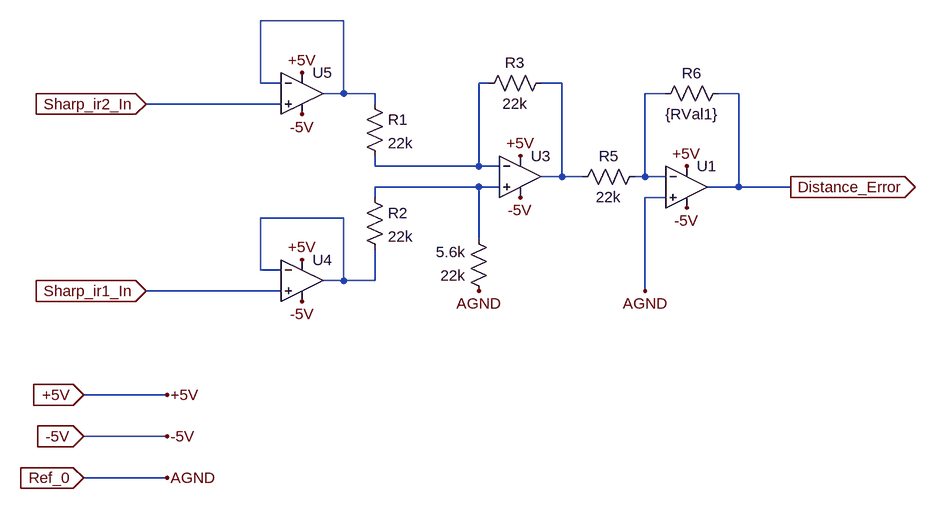
[diagram p0: schematic Sensor_Interface_SharpIR.asc]
Sensor_Interface_SharpIR.asc, the LTspice schematic file:
Version 4.1
SHEET 1 880 680
WIRE -80 -240 -208 -240
WIRE -208 -144 -208 -240
WIRE -176 -144 -208 -144
WIRE 144 -144 128 -144
WIRE 256 -144 224 -144
WIRE -80 -128 -80 -240
WIRE -80 -128 -112 -128
WIRE -32 -128 -80 -128
WIRE 416 -128 384 -128
WIRE 528 -128 496 -128
WIRE -176 -112 -384 -112
WIRE -32 -112 -32 -128
WIRE -32 -16 -32 -32
WIRE 128 -16 128 -144
WIRE 128 -16 -32 -16
WIRE 160 -16 128 -16
WIRE 256 0 256 -144
WIRE 256 0 224 0
WIRE 288 0 256 0
WIRE 384 0 384 -128
WIRE 384 0 368 0
WIRE 416 0 384 0
WIRE 128 16 -32 16
WIRE 160 16 128 16
WIRE 528 16 528 -128
WIRE 528 16 480 16
WIRE 608 16 528 16
WIRE -32 32 -32 16
WIRE 416 32 384 32
WIRE -80 64 -208 64
WIRE 128 96 128 16
WIRE -208 144 -208 64
WIRE -176 144 -208 144
WIRE -80 160 -80 64
WIRE -80 160 -112 160
WIRE -32 160 -32 112
WIRE -32 160 -80 160
WIRE -176 176 -384 176
WIRE 384 176 384 32
WIRE -352 336 -480 336
WIRE -352 400 -480 400
WIRE -352 464 -480 464
FLAG -384 176 Sharp_ir1_In
IOPIN -384 176 In
FLAG -384 -112 Sharp_ir2_In
IOPIN -384 -112 In
FLAG 608 16 Distance_Error
IOPIN 608 16 Out
FLAG 192 -32 +5V
FLAG 448 -16 +5V
FLAG 192 32 -5V
FLAG 448 48 -5V
FLAG -144 128 +5V
FLAG -144 192 -5V
FLAG -144 -160 +5V
FLAG -144 -96 -5V
FLAG 128 176 AGND
FLAG 384 176 AGND
FLAG -480 336 +5V
IOPIN -480 336 In
FLAG -480 400 -5V
IOPIN -480 400 In
FLAG -480 464 Ref_0
IOPIN -480 464 In
FLAG -352 336 +5V
FLAG -352 400 -5V
FLAG -352 464 AGND
SYMBOL OpAmps\\UniversalOpAmp2 192 0 R0
SYMATTR InstName U3
SYMATTR Value2 Avol=200k GBW=3Meg Slew=13Meg
SYMATTR SpiceLine Ilimit=25m Rail=1.5 Vos=3m
SYMATTR SpiceLine2 En=18n Enk=100 In=0.01p Ink=10 Rin=1T
SYMBOL OpAmps\\UniversalOpAmp2 -144 160 R0
SYMATTR InstName U4
SYMATTR Value2 Avol=200k GBW=3Meg Slew=13Meg
SYMATTR SpiceLine Ilimit=25m Rail=1.5 Vos=3m
SYMATTR SpiceLine2 En=18n Enk=100 In=0.01p Ink=10 Rin=1T
SYMBOL OpAmps\\UniversalOpAmp2 -144 -128 R0
SYMATTR InstName U5
SYMATTR Value2 Avol=200k GBW=3Meg Slew=13Meg
SYMATTR SpiceLine Ilimit=25m Rail=1.5 Vos=3m
SYMATTR SpiceLine2 En=18n Enk=100 In=0.01p Ink=10 Rin=1T
SYMBOL res -48 -128 R0
SYMATTR InstName R1
SYMATTR Value 22k
SYMBOL res -48 16 R0
SYMATTR InstName R2
SYMATTR Value 22k
SYMBOL res 240 -160 R90
WINDOW 0 0 56 VBottom 2
WINDOW 3 32 56 VTop 2
SYMATTR InstName R3
SYMATTR Value 22k
SYMBOL res 144 192 R180
WINDOW 0 36 76 Left 2
WINDOW 3 36 40 Left 2
SYMATTR InstName 5.6k
SYMATTR Value 22k
SYMBOL OpAmps\\UniversalOpAmp2 448 16 R0
SYMATTR InstName U1
SYMATTR Value2 Avol=200k GBW=3Meg Slew=13Meg
SYMATTR SpiceLine Ilimit=25m Rail=1.5 Vos=3m
SYMATTR SpiceLine2 En=18n Enk=100 In=0.01p Ink=10 Rin=1T
SYMBOL res 384 -16 R90
WINDOW 0 0 56 VBottom 2
WINDOW 3 32 56 VTop 2
SYMATTR InstName R5
SYMATTR Value 22k
SYMBOL res 512 -144 R90
WINDOW 0 0 56 VBottom 2
WINDOW 3 32 56 VTop 2
SYMATTR InstName R6
SYMATTR Value {RVal1}

The netlist it stands for:
* Sensor_Interface_SharpIR.asc
X§U3 N005 N002 +5V -5V N003 level2 Avol=200k GBW=3Meg Slew=13Meg Ilimit=25m Rail=1.5 Vos=3m En=18n Enk=100 In=0.01p Ink=10 Rin=1T  ; pins In+ In- V+ V- OUT
X§U4 Sharp_ir1_In N006 +5V -5V N006 level2 Avol=200k GBW=3Meg Slew=13Meg Ilimit=25m Rail=1.5 Vos=3m En=18n Enk=100 In=0.01p Ink=10 Rin=1T  ; pins In+ In- V+ V- OUT
X§U5 Sharp_ir2_In N001 +5V -5V N001 level2 Avol=200k GBW=3Meg Slew=13Meg Ilimit=25m Rail=1.5 Vos=3m En=18n Enk=100 In=0.01p Ink=10 Rin=1T  ; pins In+ In- V+ V- OUT
R1 N001 N002 22k
R2 N005 N006 22k
R3 N003 N002 22k
R§5.6k Ref_0 N005 22k
X§U1 Ref_0 N004 +5V -5V Distance_Error level2 Avol=200k GBW=3Meg Slew=13Meg Ilimit=25m Rail=1.5 Vos=3m En=18n Enk=100 In=0.01p Ink=10 Rin=1T  ; pins In+ In- V+ V- OUT
R5 N004 N003 22k
R6 Distance_Error N004 {RVal1}
.lib UniversalOpAmp2.lib
.backanno
.end